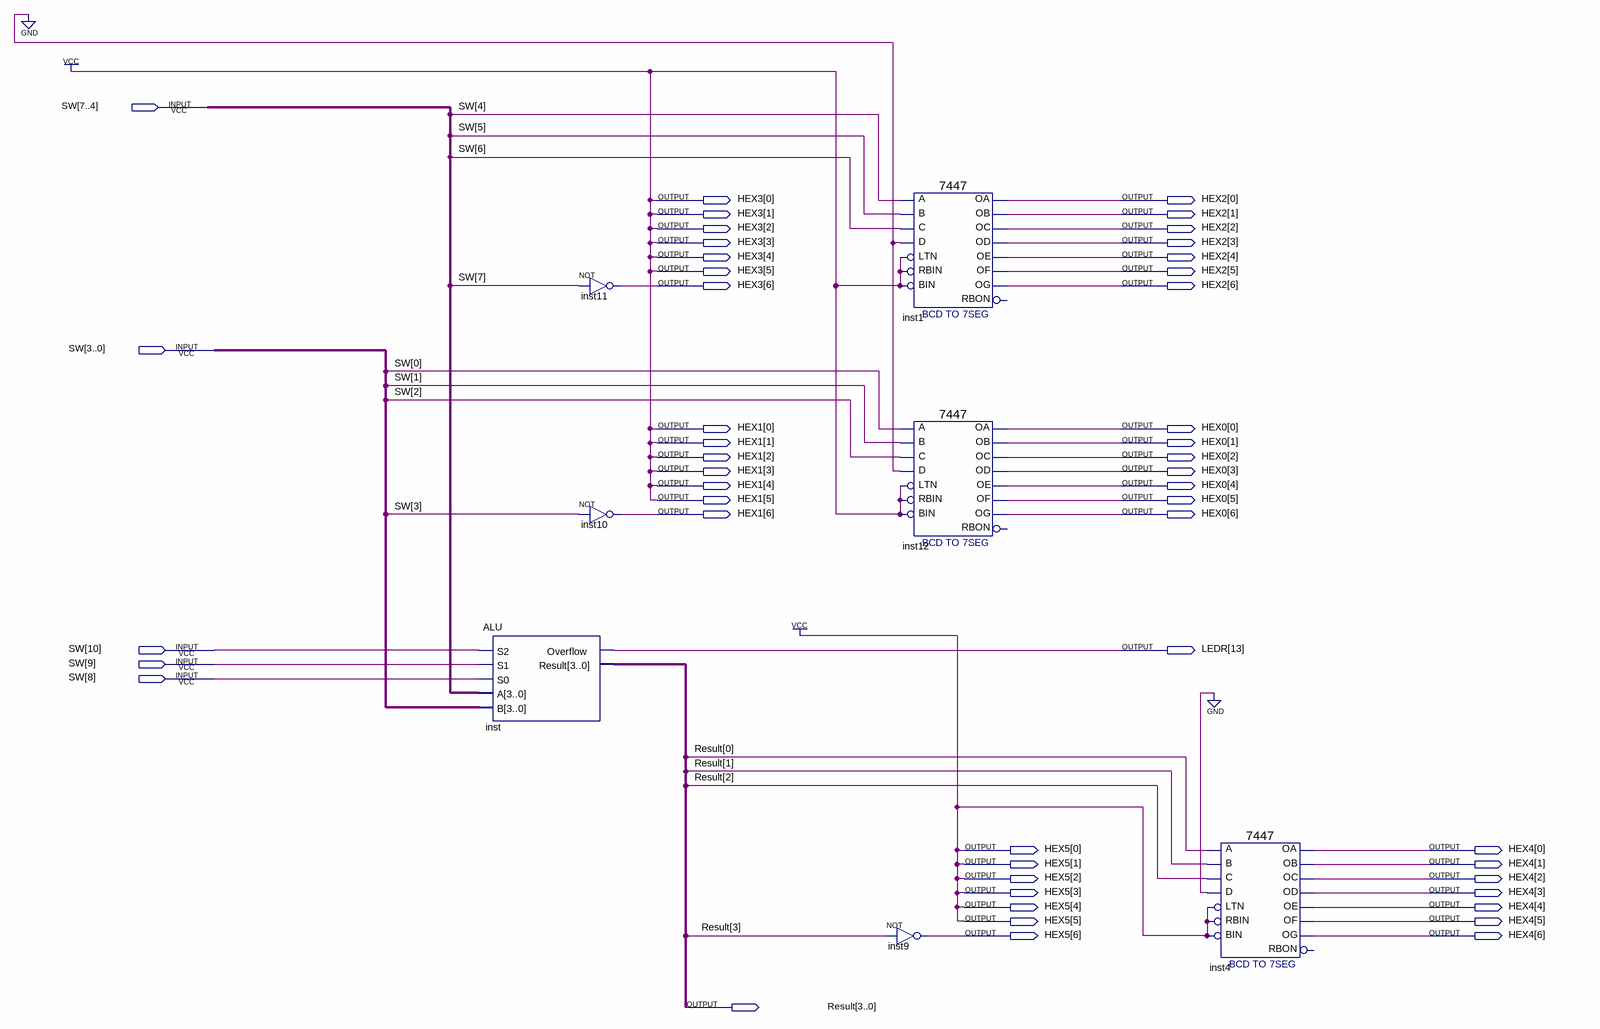
[diagram p0: schematic sheet]
// Quartus schematic cau01_kit.bdf as structural Verilog: 7 symbols, 49 pins
module cau01_kit (
  input  [10:0] SW,
  output [6:0] HEX3,
  output [6:0] HEX2,
  output [6:0] HEX1,
  output [6:0] HEX0,
  output [13:13] LEDR,
  output [6:0] HEX5,
  output [6:0] HEX4,
  output [3:0] Result
);

  ALU inst (.S2(SW[10]), .S1(SW[9]), .S0(SW[8]), .A(SW[7:4]), .B(SW[3:0]), .Overflow(LEDR[13]), .Result(Result));
  not inst11 (HEX3[6], SW[7]);
  not inst10 (HEX1[6], SW[3]);
  \7447  inst1 (
    .LTN(1'b1), .B(SW[5]), .C(SW[6]), .D(1'b0), .RBIN(1'b1), .BIN(1'b1), .A(SW[4]), .OB(HEX2[1]),
    .OC(HEX2[2]), .OE(HEX2[4]), .OD(HEX2[3]), .OF(HEX2[5]), .OG(HEX2[6]), .OA(HEX2[0]));  // open: RBON
  \7447  inst12 (
    .LTN(1'b1), .B(SW[1]), .C(SW[2]), .D(1'b0), .RBIN(1'b1), .BIN(1'b1), .A(SW[0]), .OB(HEX0[1]),
    .OC(HEX0[2]), .OE(HEX0[4]), .OD(HEX0[3]), .OF(HEX0[5]), .OG(HEX0[6]), .OA(HEX0[0]));  // open: RBON
  not inst9 (HEX5[6], Result[3]);
  \7447  inst4 (
    .LTN(1'b1), .B(Result[1]), .C(Result[2]), .D(1'b0), .RBIN(1'b1), .BIN(1'b1), .A(Result[0]), .OB(HEX4[1]),
    .OC(HEX4[2]), .OE(HEX4[4]), .OD(HEX4[3]), .OF(HEX4[5]), .OG(HEX4[6]), .OA(HEX4[0]));  // open: RBON

  assign HEX1[5:0] = {6{1'b1}};
  assign HEX3[5:0] = {6{1'b1}};
  assign HEX5[5:0] = {6{1'b1}};
endmodule
